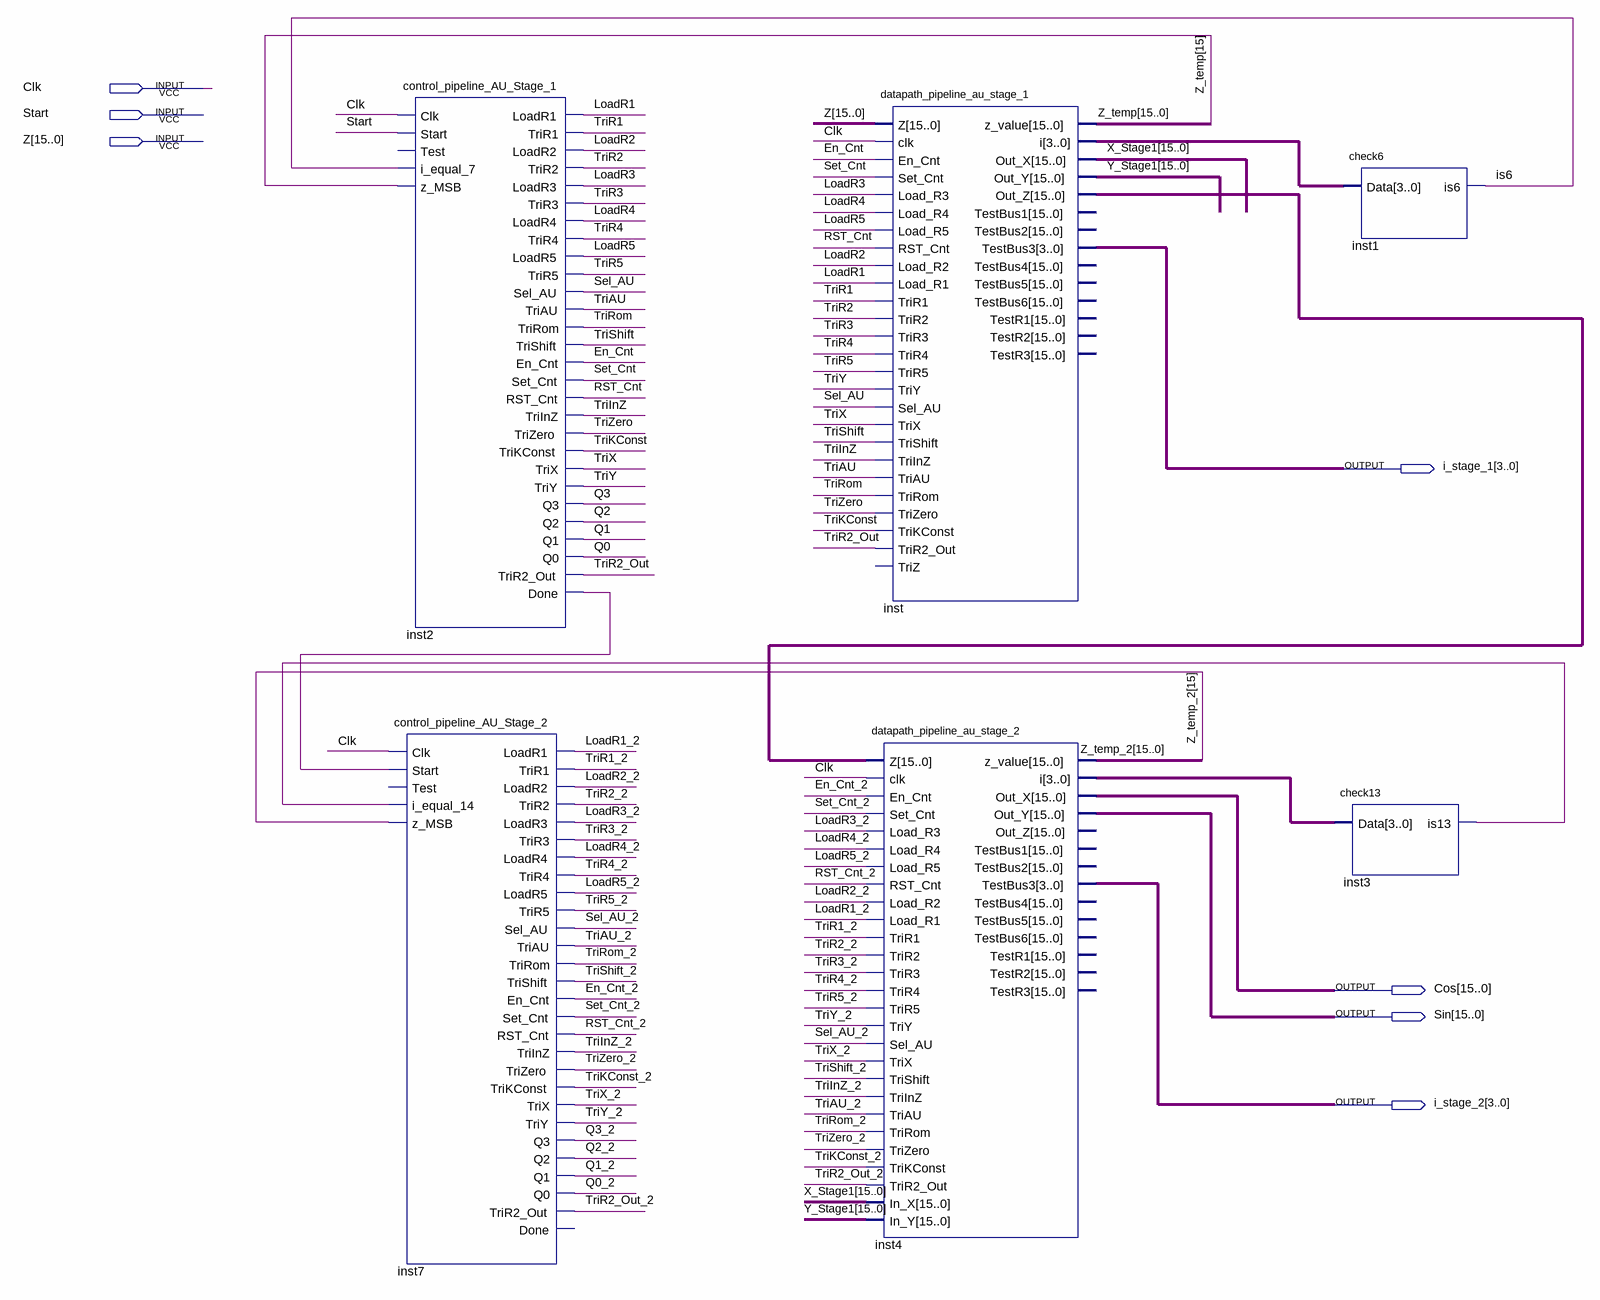
[diagram p0: schematic sheet]
// Quartus schematic ver3_pipeline_au_datapath.bdf as structural Verilog: 6 symbols, 7 pins
module ver3_pipeline_au_datapath (
  input  Clk,
  input  Start,
  input  [15:0] Z,
  output [3:0] i_stage_1,
  output [15:0] Cos,
  output [15:0] Sin,
  output [3:0] i_stage_2
);

  wire En_Cnt, En_Cnt_2, inst2_done, inst3_is13, is6, LoadR1, LoadR1_2, LoadR2, LoadR2_2, LoadR3, LoadR3_2,
       LoadR4, LoadR4_2, LoadR5, LoadR5_2, Q0, Q0_2, Q1, Q1_2, Q2, Q2_2, Q3, Q3_2, RST_Cnt, RST_Cnt_2,
       Sel_AU, Sel_AU_2, Set_Cnt, Set_Cnt_2, TriAU, TriAU_2, TriInZ, TriInZ_2, TriKConst, TriKConst_2, TriR1,
       TriR1_2, TriR2, TriR2_2, TriR2_Out, TriR2_Out_2, TriR3, TriR3_2, TriR4, TriR4_2, TriR5, TriR5_2,
       TriRom, TriRom_2, TriShift, TriShift_2, TriX, TriX_2, TriY, TriY_2, TriZero, TriZero_2;
  wire [3:0] inst4_i, inst_i;
  wire [15:0] inst_out_z, X_Stage1, Y_Stage1, Z_temp, Z_temp_2;

  control_pipeline_AU_Stage_1 inst2 (
    .Clk(Clk), .Start(Start), .i_equal_7(is6), .z_MSB(Z_temp[15]), .LoadR1(LoadR1), .TriR1(TriR1),
    .LoadR2(LoadR2), .TriR2(TriR2), .LoadR3(LoadR3), .TriR3(TriR3), .LoadR4(LoadR4), .TriR4(TriR4),
    .LoadR5(LoadR5), .TriR5(TriR5), .Sel_AU(Sel_AU), .TriAU(TriAU), .TriRom(TriRom), .TriShift(TriShift),
    .En_Cnt(En_Cnt), .Set_Cnt(Set_Cnt), .RST_Cnt(RST_Cnt), .TriInZ(TriInZ), .TriZero(TriZero),
    .TriKConst(TriKConst), .TriX(TriX), .TriY(TriY), .Q3(Q3), .Q2(Q2), .Q1(Q1), .Q0(Q0),
    .TriR2_Out(TriR2_Out), .Done(inst2_done));  // open: Test
  control_pipeline_AU_Stage_2 inst7 (
    .Clk(Clk), .Start(inst2_done), .i_equal_14(inst3_is13), .z_MSB(Z_temp_2[15]), .LoadR1(LoadR1_2),
    .TriR1(TriR1_2), .LoadR2(LoadR2_2), .TriR2(TriR2_2), .LoadR3(LoadR3_2), .TriR3(TriR3_2),
    .LoadR4(LoadR4_2), .TriR4(TriR4_2), .LoadR5(LoadR5_2), .TriR5(TriR5_2), .Sel_AU(Sel_AU_2),
    .TriAU(TriAU_2), .TriRom(TriRom_2), .TriShift(TriShift_2), .En_Cnt(En_Cnt_2), .Set_Cnt(Set_Cnt_2),
    .RST_Cnt(RST_Cnt_2), .TriInZ(TriInZ_2), .TriZero(TriZero_2), .TriKConst(TriKConst_2), .TriX(TriX_2),
    .TriY(TriY_2), .Q3(Q3_2), .Q2(Q2_2), .Q1(Q1_2), .Q0(Q0_2), .TriR2_Out(TriR2_Out_2));  // open: Test, Done
  datapath_pipeline_au_stage_1 inst (
    .Z(Z), .clk(Clk), .En_Cnt(En_Cnt), .Set_Cnt(Set_Cnt), .Load_R3(LoadR3), .Load_R4(LoadR4),
    .Load_R5(LoadR5), .RST_Cnt(RST_Cnt), .Load_R2(LoadR2), .Load_R1(LoadR1), .TriR1(TriR1), .TriR2(TriR2),
    .TriR3(TriR3), .TriR4(TriR4), .TriR5(TriR5), .TriY(TriY), .Sel_AU(Sel_AU), .TriX(TriX),
    .TriShift(TriShift), .TriInZ(TriInZ), .TriAU(TriAU), .TriRom(TriRom), .TriZero(TriZero),
    .TriKConst(TriKConst), .TriR2_Out(TriR2_Out), .z_value(Z_temp), .i(inst_i), .Out_X(X_Stage1),
    .Out_Y(Y_Stage1), .Out_Z(inst_out_z), .TestBus3(i_stage_1));  // open: TriZ, TestBus1, TestBus2, TestBus4, TestBus5, TestBus6, TestR1, TestR2, TestR3
  datapath_pipeline_au_stage_2 inst4 (
    .Z(inst_out_z), .clk(Clk), .En_Cnt(En_Cnt_2), .Set_Cnt(Set_Cnt_2), .Load_R3(LoadR3_2),
    .Load_R4(LoadR4_2), .Load_R5(LoadR5_2), .RST_Cnt(RST_Cnt_2), .Load_R2(LoadR2_2), .Load_R1(LoadR1_2),
    .TriR1(TriR1_2), .TriR2(TriR2_2), .TriR3(TriR3_2), .TriR4(TriR4_2), .TriR5(TriR5_2), .TriY(TriY_2),
    .Sel_AU(Sel_AU_2), .TriX(TriX_2), .TriShift(TriShift_2), .TriInZ(TriInZ_2), .TriAU(TriAU_2),
    .TriRom(TriRom_2), .TriZero(TriZero_2), .TriKConst(TriKConst_2), .TriR2_Out(TriR2_Out_2),
    .In_X(X_Stage1), .In_Y(Y_Stage1), .z_value(Z_temp_2), .i(inst4_i), .Out_X(Cos), .Out_Y(Sin),
    .TestBus3(i_stage_2));  // open: Out_Z, TestBus1, TestBus2, TestBus4, TestBus5, TestBus6, TestR1, TestR2, TestR3
  check13 inst3 (.Data(inst4_i), .is13(inst3_is13));
  check6 inst1 (.Data(inst_i), .is6(is6));
endmodule
